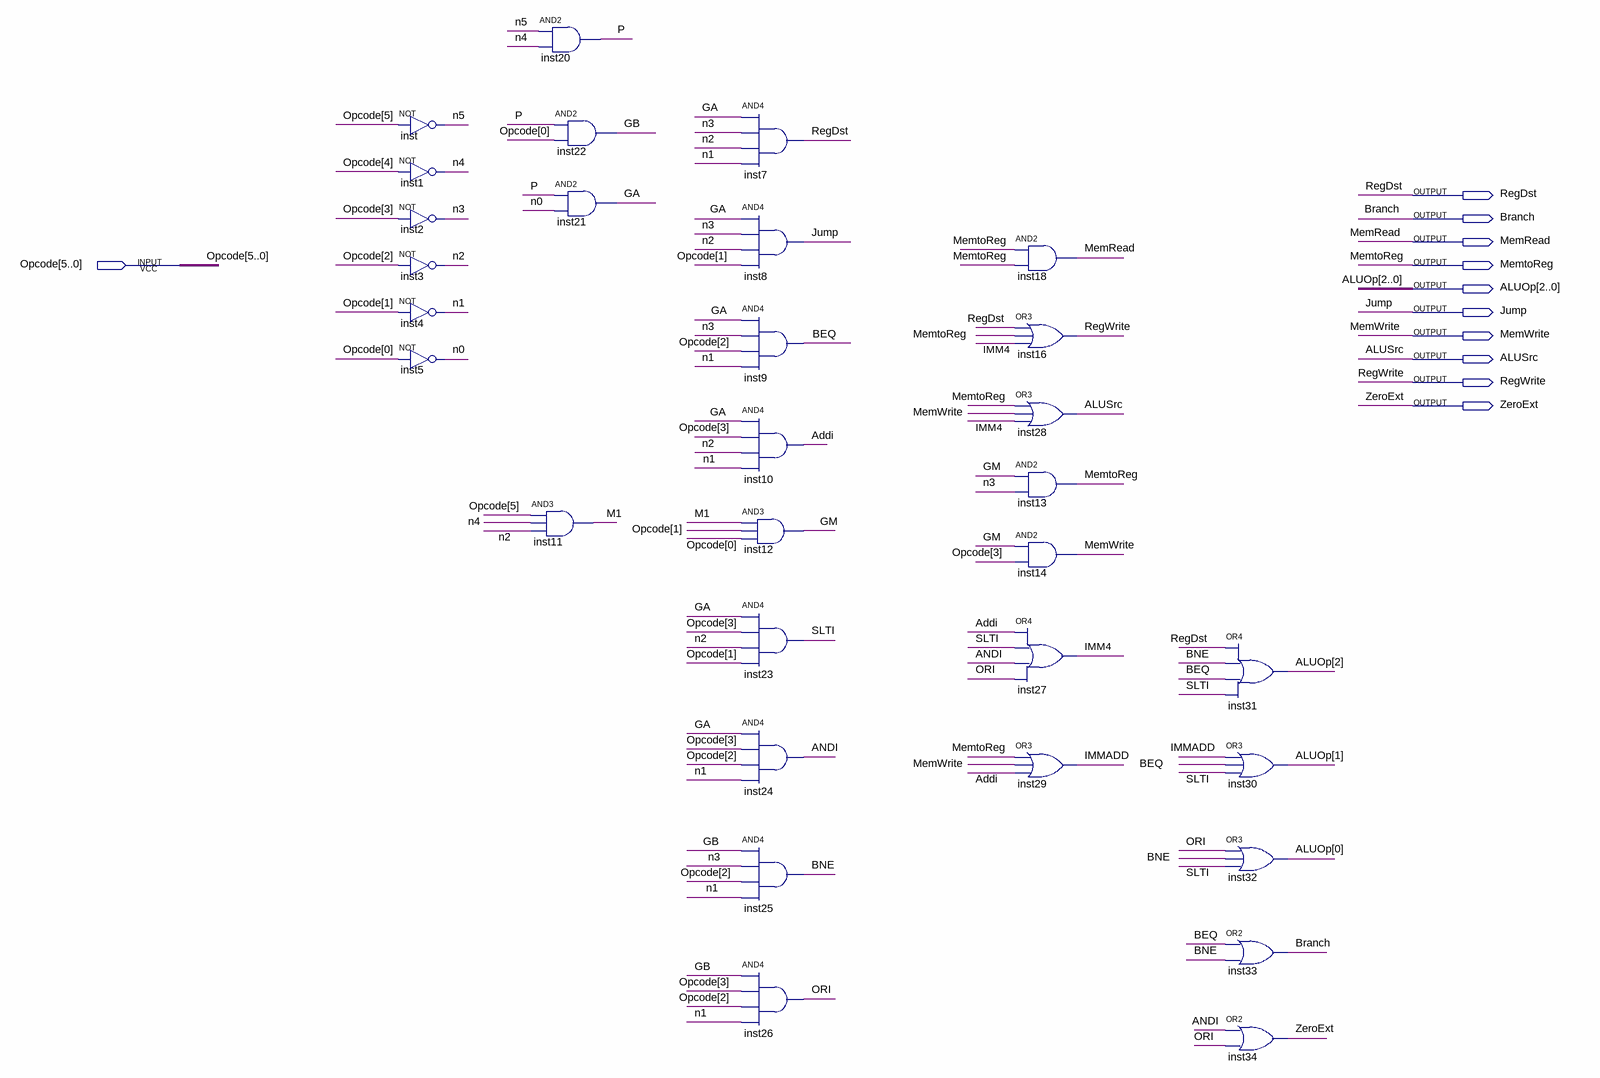
[diagram p0: schematic sheet]
// Quartus schematic ControlUnit.bdf as structural Verilog: 31 symbols, 11 pins
module ControlUnit (
  input  [5:0] Opcode,
  output RegDst,
  output Branch,
  output MemRead,
  output MemtoReg,
  output [2:0] ALUOp,
  output Jump,
  output MemWrite,
  output ALUSrc,
  output RegWrite,
  output ZeroExt
);

  wire Addi, ANDI, BEQ, BNE, GA, GB, GM, IMM4, IMMADD, M1, n0, n1, n2, n3, n4, n5, ORI, P, SLTI;

  not inst (n5, Opcode[5]);
  not inst1 (n4, Opcode[4]);
  not inst2 (n3, Opcode[3]);
  not inst3 (n2, Opcode[2]);
  not inst4 (n1, Opcode[1]);
  not inst5 (n0, Opcode[0]);
  and inst20 (P, n5, n4);
  and inst22 (GB, P, Opcode[0]);
  and inst21 (GA, P, n0);
  and inst11 (M1, Opcode[5], n4, n2);
  and inst7 (RegDst, GA, n3, n2, n1);
  and inst8 (Jump, GA, n3, n2, Opcode[1]);
  and inst9 (BEQ, GA, n3, Opcode[2], n1);
  and inst10 (Addi, GA, Opcode[3], n2, n1);
  and inst12 (GM, M1, Opcode[1], Opcode[0]);
  and inst23 (SLTI, GA, Opcode[3], n2, Opcode[1]);
  and inst24 (ANDI, GA, Opcode[3], Opcode[2], n1);
  and inst25 (BNE, GB, n3, Opcode[2], n1);
  and inst26 (ORI, GB, Opcode[3], Opcode[2], n1);
  and inst18 (MemRead, MemtoReg, MemtoReg);
  or inst16 (RegWrite, RegDst, MemtoReg, IMM4);
  or inst28 (ALUSrc, MemtoReg, MemWrite, IMM4);
  and inst13 (MemtoReg, GM, n3);
  and inst14 (MemWrite, GM, Opcode[3]);
  or inst27 (IMM4, Addi, SLTI, ANDI, ORI);
  or inst29 (IMMADD, MemtoReg, MemWrite, Addi);
  or inst31 (ALUOp[2], RegDst, BNE, BEQ, SLTI);
  or inst30 (ALUOp[1], IMMADD, BEQ, SLTI);
  or inst32 (ALUOp[0], ORI, BNE, SLTI);
  or inst33 (Branch, BEQ, BNE);
  or inst34 (ZeroExt, ANDI, ORI);
endmodule
